# Altium project Glove_Altium.PrjPcb
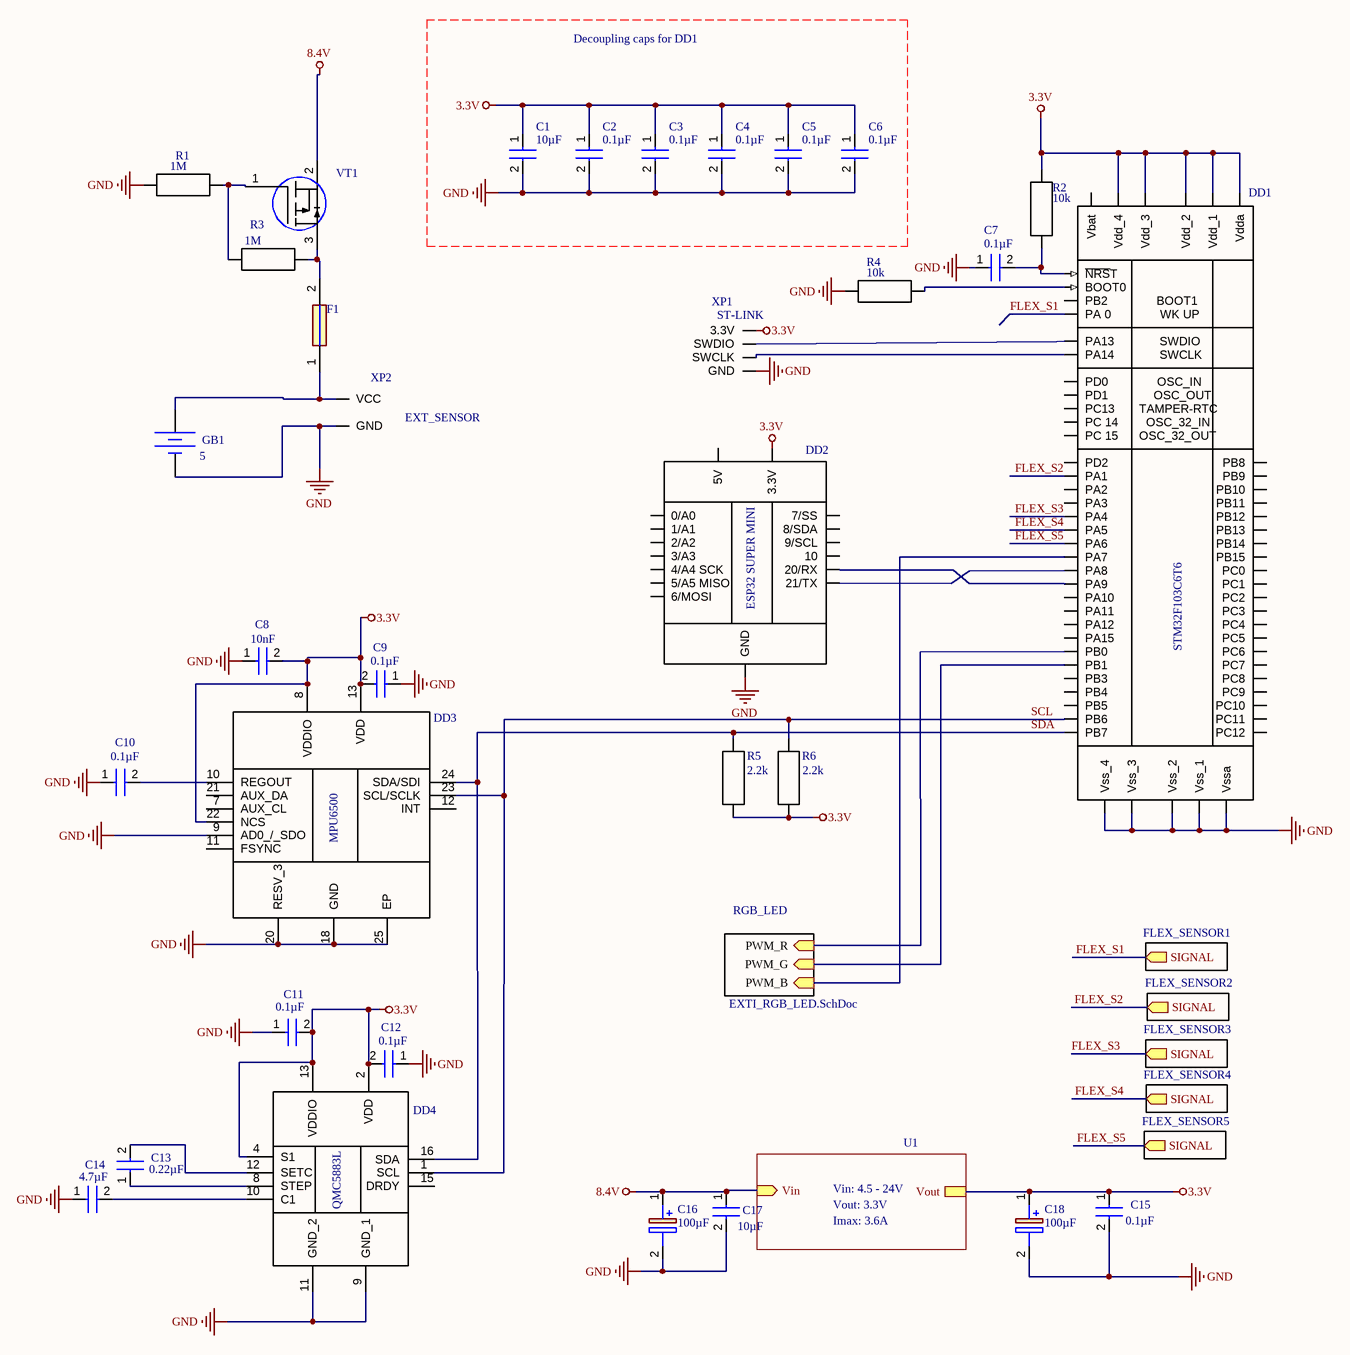
[diagram p0: Glove.SchDoc]
3 sheets, 68 parts. Net scope: hierarchical (ports join the sheet entries above them; power ports are global).
Sheets:
  Glove.SchDoc
    FLEX_SENSOR1 = EXT_FLEX_SENSOR.SchDoc
    RGB_LED = EXTI_RGB_LED.SchDoc
    FLEX_SENSOR2 = EXT_FLEX_SENSOR.SchDoc
    FLEX_SENSOR3 = EXT_FLEX_SENSOR.SchDoc
    FLEX_SENSOR4 = EXT_FLEX_SENSOR.SchDoc
    FLEX_SENSOR5 = EXT_FLEX_SENSOR.SchDoc

## Sheet Glove.SchDoc
size 420 x 297 mm; SheetNumber: 1; SheetTotal: 4

### Parts
(Parts that share a designator on the sheet are numbered #1, #2 ... from top to bottom, then left to right.)
C1  10µF  [CAPC2012X145N]
C2  0.1µF  [CAPC2012X145N]
C3  0.1µF  [CAPC2012X145N]
C4  0.1µF  [CAPC2012X145N]
C5  0.1µF  [CAPC2012X145N]
C6  0.1µF  [CAPC2012X145N]
C7  0.1µF  [CAPC2012X145N]
C8  10nF  [CAPC2012X145N]
C9  0.1µF  [CAPC2012X145N]
C10  0.1µF  [CAPC2012X145N]
C11  0.1µF  [CAPC2012X145N]
C12  0.1µF  [CAPC2012X145N]
C13  0.22µF  [CAPC2012X145N]
C14  4.7µF  [CAPC2012X145N]
C15  0.1µF  [CAPC2012X145N]
C16  100µF  [T491C]
C17  10µF  [CAPC2012X145N]
C18  100µF  [T491C]
DD1  (no value)  [STM32F103C6T6]
DD2  (no value)  [ESP32C3_SUPER_MINI]
DD3  (no value)  [QFN40P300X300X105-25N-D]
DD4  (no value)  [QMC5883L]
F1  Schurter  USI 8053370874 I = 4A, U = 32V  [FUSC3116X70N]  (value not drawn)
GB1  DC Magnitude: 5  (hidden comment: Constant Voltage Source)
R1#1  1M  [CAPC2012X145N]
R2#1  10k  [CAPC2012X145N]
R3#1  1M  [CAPC2012X145N]
R4  10k  [CAPC2012X145N]
R5  2.2k  [CAPC2012X145N]
R6  2.2k  [CAPC2012X145N]
VT1  IRLML6401  [SOT95P237X112-3N]  (value not drawn)
XP1#1  ST-LINK  [ST-LINK]
XP2  EXT_SENSOR  [EXT_SENSOR]

### Sub-sheets
FLEX_SENSOR1 = EXT_FLEX_SENSOR.SchDoc: SIGNAL (out)
FLEX_SENSOR2 = EXT_FLEX_SENSOR.SchDoc: SIGNAL (out)
FLEX_SENSOR3 = EXT_FLEX_SENSOR.SchDoc: SIGNAL (out)
FLEX_SENSOR4 = EXT_FLEX_SENSOR.SchDoc: SIGNAL (out)
FLEX_SENSOR5 = EXT_FLEX_SENSOR.SchDoc: SIGNAL (out)
RGB_LED = EXTI_RGB_LED.SchDoc: PWM_B (in), PWM_G (in), PWM_R (in)
U1 = Buck5V.SchDoc (file not in this document): Vin (in), Vout  | R2: 7.5k; R4: 75k; R9: 20k

### Nets
3.3V: C1.1 C2.1 C3.1 C4.1 C5.1 C6.1 C8.2 C9.2 C11.2 C12.2 C15.1 C18.1(+) DD1.13(Vdda) DD1.19(Vdd_4) DD1.32(Vdd_1) DD1.48(Vdd_2) DD1.64(Vdd_3) DD2.3.3V DD3.8(VDDIO) DD3.13(VDD) DD3.22(NCS) DD4.2(VDD) DD4.4(S1) DD4.13(VDDIO) R2#1.1 R5.1 R6.1 XP1#1.3.3V ; sheet U1/Vout
8.4V: C16.1(+) C17.1 VT1.2(S) ; sheet U1/Vin
GND: C1.2 C2.2 C3.2 C4.2 C5.2 C6.2 C7.1 C8.1 C9.1 C10.1 C11.1 C12.1 C14.1 C15.2 C16.2(-) C17.2 C18.2(-) DD1.12(Vssa) DD1.18(Vss_4) DD1.31(Vss_1) DD1.47(Vss_2) DD1.63(Vss_3) DD2.GND DD3.9(AD0_/_SDO) DD3.18(GND) DD3.20(RESV_3) DD3.25(EP) DD4.9(GND_1) DD4.11(GND_2) GB1.2 R1#1.1 R4.1 XP1#1.GND XP2.2(GND)
FLEX_S1: DD1.14(PA_0______________WK_UP) ; sheet FLEX_SENSOR1/SIGNAL
FLEX_S2: DD1.15(PA1) ; sheet FLEX_SENSOR2/SIGNAL
FLEX_S3: DD1.20(PA4) ; sheet FLEX_SENSOR3/SIGNAL
FLEX_S4: DD1.21(PA5) ; sheet FLEX_SENSOR4/SIGNAL
FLEX_S5: DD1.22(PA6) ; sheet FLEX_SENSOR5/SIGNAL
SCL: DD1.58(PB6) DD3.23(SCL/SCLK) DD4.1(SCL) R6.2
SDA: DD1.59(PB7) DD3.24(SDA/SDI) DD4.16(SDA) R5.2
NetC7_2: C7.2 DD1.7(~{NRS}T) R2#1.2
NetC10_2: C10.2 DD3.10(REGOUT)
NetC13_1: C13.1 DD4.8(STEP)
NetC13_2: C13.2 DD4.12(SETC)
NetC14_2: C14.2 DD4.10(C1)
NetDD1_23: DD1.23(PA7) ; sheet RGB_LED/PWM_B
NetDD1_26: DD1.26(PB0) ; sheet RGB_LED/PWM_R
NetDD1_27: DD1.27(PB1) ; sheet RGB_LED/PWM_G
NetDD1_41: DD1.41(PA8) DD2.GPIO21(21/TX)
NetDD1_42: DD1.42(PA9) DD2.GPIO20(20/RX)
NetDD1_46: DD1.46(PA13_____________SWDIO) XP1#1.SWDIO
NetDD1_49: DD1.49(PA14_____________SWCLK) XP1#1.SWCLK
NetDD1_60: DD1.60(BOOT0) R4.2
NetF1_1: F1.1 GB1.1 XP2.1(VCC)
NetF1_2: F1.2 R3#1.2 VT1.3(D)
NetR1#1_2: R1#1.2 R3#1.1 VT1.1(G)

Not connected (* = marked no-connect by the designer): DD1 1(Vbat) 2(PC13_______TAMPER-RTC) 3(PC_14________OSC_32_IN) 4(PC_15______OSC_32_OUT) 5(PD0______________OSC_IN) 6(PD1_____________OSC_OUT) 8(PC0) 9(PC1) 10(PC2) 11(PC3) 16(PA2) 17(PA3) 24(PC4) 25(PC5) 28(PB2______________BOOT1) 29(PB10) 30(PB11) 33(PB12) 34(PB13) 35(PB14) 36(PB15) 37(PC6) 38(PC7) 39(PC8) 40(PC9) 43(PA10) 44(PA11) 45(PA12) 50(PA15) 51(PC10) 52(PC11) 53(PC12) 54(PD2) 55(PB3) 56(PB4) 57(PB5) 61(PB8) 62(PB9); DD2 5V GPIO0(0/A0) GPIO1(1/A1) GPIO2(2/A2) GPIO3(3/A3) GPIO4(4/A4_SCK) GPIO5(5/A5_MISO) GPIO6(6/MOSI) GPIO7(7/SS) GPIO8(8/SDA) GPIO9(9/SCL) GPIO10(10); DD3 7(AUX_CL) 11(FSYNC) 12(INT) 21(AUX_DA); DD4 15(DRDY)

### Notes on the sheet
- Decoupling caps for DD1
- Vin: 4.5 - 24V
- Vout: 3.3V
- Imax: 3.6A
- THIS DOCUMENT AND THE DATA DISCLOSED HEREIN OR
- HEREWITH IS THE PROPERTY OF ALTIUM LIMITED AND MAY
- DWG NO:
- REVISION
- REV:
- DESCRIPTION
- DATE
- APPROVED
- BE FREELY DISTRIBUTED IN WHOLE. NO RIGHTS ARE
- RESERVED OR EXPRESS OR IMPLIED WARANTEE GIVEN.
- ENG:
- APPROVALS
- PROJECT
- DSN:
- CHK:
- REFERENCE DOCUMENTS
- PROJECT REVISION:
- TITLE
- DOCUMENT REVISION:
- DESIGN ITEM:
- BOM:
- FAB DWG:
- PCB DWG:
- ASSY DWG:
- SCALE:
- A3
- SIZE
- CAGE CODE
- FILE NAME
- DWG NO.
- SHEET
- OF
- REV
- (in symbol ESP32_SUPER_MINI) ESP32 SUPER MINI
- (in symbol MPU-6500) MPU6500

### Library data of the parts
C1-C15 C17 = 0805C: Capacitor; Manufacturer_Name: SAMSUNG; Manufacturer_Part_Number: CL21A106KAYNNNE; Datasheet Link: https://datasheet.datasheetarchive.com/originals/distributors/Datasheets_SAMA/6a45835c9b7400e9b49c55c38a8ff4a2.pdf; Height: 1.45mm; Mouser Part Number: 187-CL21A106KAYNNNE; Mouser Price/Stock: https://www.mouser.co.uk/ProductDetail/Samsung-Electro-Mechanics/CL21A106KAYNNNE?qs=yOVawPpwOwmTXAd4dJtNjA%3D%3D; Arrow Part Number: CL21A106KAYNNNE; Arrow Price/Stock: https://www.arrow.com/en/products/cl21a106kaynnne/samsung-electro-mechanics?utm_currency=USD&region=nac
C16 C18 = Capacitor Tantal Case C: Capacitor Polarised; Manufacturer_Name: YAGEO; Manufacturer_Part_Number: T491C107M016AT; Datasheet Link: https://content.kemet.com/datasheets/KEM_T2005_T491.pdf; Height: 2.8mm; Mouser Part Number: 80-T491C107M016AT; Mouser Price/Stock: https://www.mouser.co.uk/ProductDetail/KEMET/T491C107M016AT?qs=W04EqCCJmmuOmj0nZmoJtg%3D%3D
DD1 = STM32F103C6T6
DD2 = ESP32_SUPER_MINI
DD3 = MPU-6500: Integrated Circuit; Manufacturer_Name: TDK; Height: 1.05mm; Manufacturer_Part_Number: MPU-6500
DD4 = QMC5883L: Integrated Circuit; Manufacturer_Name: QST; Datasheet Link: https://datasheet.lcsc.com/lcsc/2012221837_QST-QMC5883L_C976032.pdf; Height: 1.02mm; Manufacturer_Part_Number: QMC5883L
F1 = SF-1206S500-2: Fuse; Manufacturer_Name: Bourns; Datasheet Link: https://componentsearchengine.com/Datasheets/2/SF-1206S500-2.pdf; Height: 0.7mm; Manufacturer_Part_Number: SF-1206S500-2; Mouser Part Number: 652-SF-1206S500-2; Mouser Price/Stock: https://www.mouser.co.uk/ProductDetail/Bourns/SF-1206S500-2?qs=GIQXYiEeHGD%252By2V9Xr7ztw%3D%3D; Arrow Part Number: SF-1206S500-2; Arrow Price/Stock: https://www.arrow.com/en/products/sf-1206s500-2/bourns?region=nac
GB1 = Battery: SimulationGenericComponent: True
R1#1 R2#1 R3#1 R4-R6 = 0805R: Resistor; Manufacturer_Name: SAMSUNG; Manufacturer_Part_Number: CL21A106KAYNNNE; Datasheet Link: https://datasheet.datasheetarchive.com/originals/distributors/Datasheets_SAMA/6a45835c9b7400e9b49c55c38a8ff4a2.pdf; Height: 1.45mm; Mouser Part Number: 187-CL21A106KAYNNNE; Mouser Price/Stock: https://www.mouser.co.uk/ProductDetail/Samsung-Electro-Mechanics/CL21A106KAYNNNE?qs=yOVawPpwOwmTXAd4dJtNjA%3D%3D; Arrow Part Number: CL21A106KAYNNNE; Arrow Price/Stock: https://www.arrow.com/en/products/cl21a106kaynnne/samsung-electro-mechanics?utm_currency=USD&region=nac
VT1 = IRLML6401: Integrated Circuit; Manufacturer_Name: UMW(Youtai Semiconductor Co.; Height: 1.12mm; Manufacturer_Part_Number: IRLML6401

## Sheet EXT_FLEX_SENSOR.SchDoc
size A4; SheetNumber: 2; SheetTotal: 4
Used 5 times, as channels FLEX_SENSOR1, FLEX_SENSOR2, FLEX_SENSOR3, FLEX_SENSOR4, FLEX_SENSOR5. Parts and nets are listed once, with the designators drawn on the sheet.
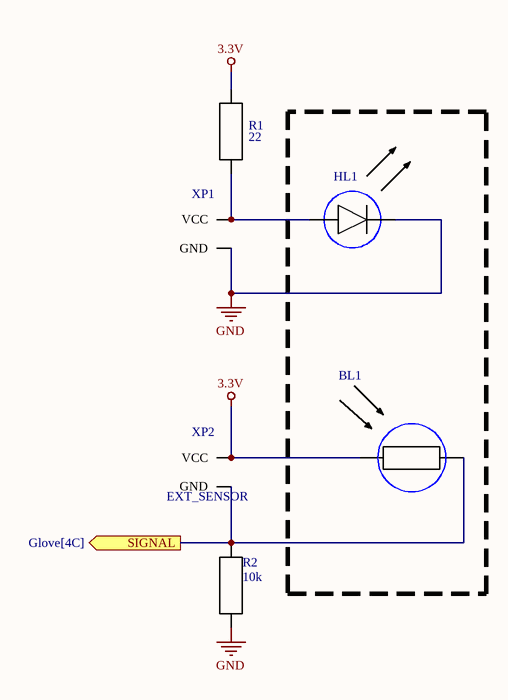
[diagram p1: EXT_FLEX_SENSOR.SchDoc]

### Parts
BL1  (no value)
HL1  (no value)
R1  22  [CAPC2012X145N]
R2  10k  [CAPC2012X145N]
XP1  (no value)  [EXT_SENSOR]
XP2  EXT_SENSOR  [EXT_SENSOR]

### Ports
SIGNAL (out, see Glove[4C])

### Nets
3.3V: BL1.0 R1.2 XP2.1(VCC)
GND: HL1.1 R2.1 XP1.2(GND)
SIGNAL: BL1.1 R2.2 XP2.2(GND) ; port SIGNAL
NetHL1_0: HL1.0 R1.1 XP1.1(VCC)

### Channels
FLEX_SENSOR1: designators end in _FLEX_SENSOR1; ports SIGNAL=FLEX_S1
FLEX_SENSOR2: designators end in _FLEX_SENSOR2; ports SIGNAL=FLEX_S2
FLEX_SENSOR3: designators end in _FLEX_SENSOR3; ports SIGNAL=FLEX_S3
FLEX_SENSOR4: designators end in _FLEX_SENSOR4; ports SIGNAL=FLEX_S4
FLEX_SENSOR5: designators end in _FLEX_SENSOR5; ports SIGNAL=FLEX_S5

### Library data of the parts
BL1 = EXTI_PHOTORESISTOR
HL1 = EXTI_LED
R1 R2 = 0805R: as R1#1 on sheet Glove; Datasheet Link: https://datasheet.datasheetarchive.com/originals/distributors/Datasheets_SAMA/6a45835c9b7400e9b49c55c38a8ff4a2.pdf; Height: 1.45mm; Mouser Part Number: 187-CL21A106KAYNNNE; Mouser Price/Stock: https://www.mouser.co.uk/ProductDetail/Samsung-Electro-Mechanics/CL21A106KAYNNNE?qs=yOVawPpwOwmTXAd4dJtNjA%3D%3D; Arrow Part Number: CL21A106KAYNNNE; Arrow Price/Stock: https://www.arrow.com/en/products/cl21a106kaynnne/samsung-electro-mechanics?utm_currency=USD&region=nac
XP1 = EXT_SENSOR

## Sheet EXTI_RGB_LED.SchDoc
size A4; SheetNumber: 3; SheetTotal: 4
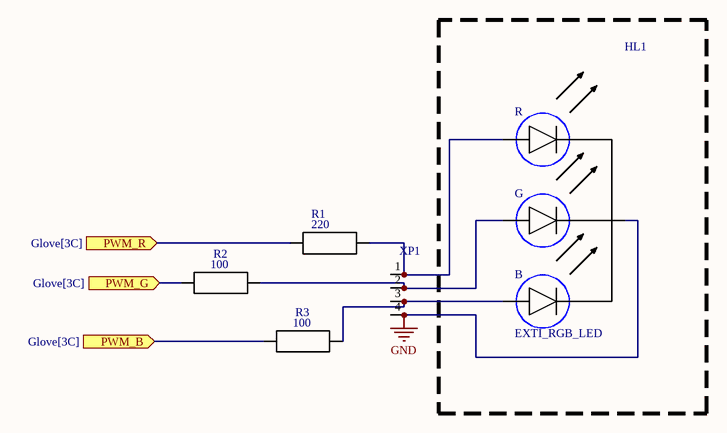
[diagram p2: EXTI_RGB_LED.SchDoc]

### Parts
(Parts that share a designator on the sheet are numbered #1, #2 ... from top to bottom, then left to right.)
HL1  EXTI_RGB_LED
R1#2  220  [CAPC2012X145N]
R2#2  100  [CAPC2012X145N]
R3#2  100  [CAPC2012X145N]
XP1#2  (no value)  [EXT_SENSOR_4pin]

### Ports
PWM_B (in, see Glove[3C]), PWM_G (in, see Glove[3C]), PWM_R (in, see Glove[3C])

### Nets
GND: HL1.4 XP1#2.4(IN)
NetDD1_23: R3#2.2 ; port PWM_B
NetDD1_26: R1#2.2 ; port PWM_R
NetDD1_27: R2#2.2 ; port PWM_G
NetHL1_0: HL1.0 R1#2.1 XP1#2.1(VCC)
NetHL1_1: HL1.1 R2#2.1 XP1#2.2(IN)
NetHL1_2: HL1.2 R3#2.1 XP1#2.3(IN)

### Notes on the sheet
- (in symbol EXTI_RGB_LED) R; G; B

### Library data of the parts
R1#2 R2#2 R3#2 = 0805R: as R1#1 on sheet Glove; Datasheet Link: https://datasheet.datasheetarchive.com/originals/distributors/Datasheets_SAMA/6a45835c9b7400e9b49c55c38a8ff4a2.pdf; Height: 1.45mm; Mouser Part Number: 187-CL21A106KAYNNNE; Mouser Price/Stock: https://www.mouser.co.uk/ProductDetail/Samsung-Electro-Mechanics/CL21A106KAYNNNE?qs=yOVawPpwOwmTXAd4dJtNjA%3D%3D; Arrow Part Number: CL21A106KAYNNNE; Arrow Price/Stock: https://www.arrow.com/en/products/cl21a106kaynnne/samsung-electro-mechanics?utm_currency=USD&region=nac
XP1#2 = EXT_SENSOR_4pin

## Nets that join several sheets
3.3V: Glove (28 pins), FLEX_SENSOR1 (BL1_FLEX_SENSOR1.0 R1_FLEX_SENSOR1.2 XP2_FLEX_SENSOR1.1), FLEX_SENSOR2 (BL1_FLEX_SENSOR2.0 R1_FLEX_SENSOR2.2 XP2_FLEX_SENSOR2.1), FLEX_SENSOR3 (BL1_FLEX_SENSOR3.0 R1_FLEX_SENSOR3.2 XP2_FLEX_SENSOR3.1), FLEX_SENSOR4 (BL1_FLEX_SENSOR4.0 R1_FLEX_SENSOR4.2 XP2_FLEX_SENSOR4.1), FLEX_SENSOR5 (BL1_FLEX_SENSOR5.0 R1_FLEX_SENSOR5.2 XP2_FLEX_SENSOR5.1)
GND: Glove (34 pins), FLEX_SENSOR1 (HL1_FLEX_SENSOR1.1 R2_FLEX_SENSOR1.1 XP1_FLEX_SENSOR1.2), EXTI_RGB_LED (HL1.4 XP1#2.4), FLEX_SENSOR2 (HL1_FLEX_SENSOR2.1 R2_FLEX_SENSOR2.1 XP1_FLEX_SENSOR2.2), FLEX_SENSOR3 (HL1_FLEX_SENSOR3.1 R2_FLEX_SENSOR3.1 XP1_FLEX_SENSOR3.2), FLEX_SENSOR4 (HL1_FLEX_SENSOR4.1 R2_FLEX_SENSOR4.1 XP1_FLEX_SENSOR4.2), FLEX_SENSOR5 (HL1_FLEX_SENSOR5.1 R2_FLEX_SENSOR5.1 XP1_FLEX_SENSOR5.2)
FLEX_S1: Glove (DD1.14), FLEX_SENSOR1 (BL1_FLEX_SENSOR1.1 R2_FLEX_SENSOR1.2 XP2_FLEX_SENSOR1.2)
FLEX_S2: Glove (DD1.15), FLEX_SENSOR2 (BL1_FLEX_SENSOR2.1 R2_FLEX_SENSOR2.2 XP2_FLEX_SENSOR2.2)
FLEX_S3: Glove (DD1.20), FLEX_SENSOR3 (BL1_FLEX_SENSOR3.1 R2_FLEX_SENSOR3.2 XP2_FLEX_SENSOR3.2)
FLEX_S4: Glove (DD1.21), FLEX_SENSOR4 (BL1_FLEX_SENSOR4.1 R2_FLEX_SENSOR4.2 XP2_FLEX_SENSOR4.2)
FLEX_S5: Glove (DD1.22), FLEX_SENSOR5 (BL1_FLEX_SENSOR5.1 R2_FLEX_SENSOR5.2 XP2_FLEX_SENSOR5.2)
NetDD1_23: Glove (DD1.23), EXTI_RGB_LED (R3#2.2)
NetDD1_26: Glove (DD1.26), EXTI_RGB_LED (R1#2.2)
NetDD1_27: Glove (DD1.27), EXTI_RGB_LED (R2#2.2)